# Altium schematic sheet HMS.Bootloader.SchDoc
size A
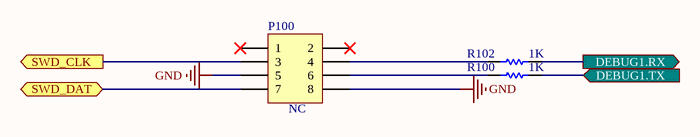
[diagram p0: HMS.Bootloader.SchDoc]

## Parts
P100  NC  [HDR2X4]
R100  1K  [RES_0402(1005)]
R102  1K  [RES_0402(1005)]

## Ports
DEBUG1.RX (out), DEBUG1.TX (in), SWD_CLK (out), SWD_DAT (bidir)

## Nets
GND: P100.5 P100.8
DEBUG1.RX: R102.2 ; port DEBUG1.RX
DEBUG1.TX: R100.2 ; port DEBUG1.TX
SWD_CLK: P100.3 ; port SWD_CLK
SWD_DAT: P100.7 ; port SWD_DAT
NetP100_4: P100.4 R102.1
NetP100_6: P100.6 R100.1

Not connected (* = marked no-connect by the designer): P100 1* 2*

## Library data of the parts
P100 = Header 4X2: Header, 4-Pin, Dual row; LatestRevisionDate: 17-Jul-2002; LatestRevisionNote: Re-released for DXP Platform.; Publisher: Altium Limited; MPN: NC; Value: NC
R100 R102 = Res1: RES 1K OHM 1% 1/8W 0402; MPN: RC0402FR-071KL; Published: 8-Jun-2000; LatestRevisionDate: 17-Jul-2002; LatestRevisionNote: Re-released for DXP Platform.; PackageReference: AXIAL-0.3; Publisher: Altium Limited; Value: 1K